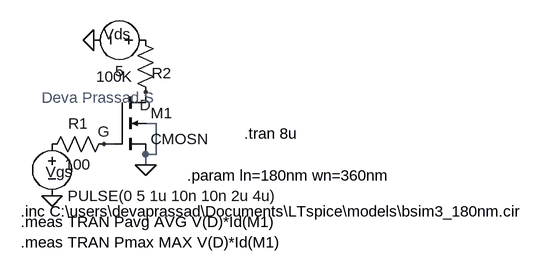
[diagram p0: schematic power.asc]
power.asc, the LTspice schematic file:
Version 4.1
SHEET 1 880 680
WIRE 176 144 160 144
WIRE 112 176 96 176
WIRE 176 192 176 144
WIRE 176 192 160 192
WIRE 160 208 160 192
FLAG 160 208 0
FLAG 80 16 0
FLAG 16 256 0
FLAG 96 176 G
FLAG 160 96 D
SYMBOL nmos4 112 96 R0
SYMATTR InstName M1
SYMATTR Value2 l={ln} w={wn}
SYMATTR Value CMOSN
SYMBOL voltage 16 160 R0
WINDOW 0 -10 59 Left 2
WINDOW 123 0 0 Left 0
WINDOW 39 0 0 Left 0
SYMATTR InstName Vgs
SYMATTR Value PULSE(0 5 1u 10n 10n 2u 4u)
SYMBOL voltage 176 16 R90
WINDOW 0 6 60 VBottom 2
WINDOW 3 32 56 VTop 2
WINDOW 123 0 0 Left 0
WINDOW 39 0 0 Left 0
SYMATTR InstName Vds
SYMATTR Value 5
SYMBOL res 112 160 R90
WINDOW 0 0 56 VBottom 2
WINDOW 3 32 56 VTop 2
SYMATTR InstName R1
SYMATTR Value 100
SYMBOL res 176 112 R180
WINDOW 0 -24 45 Left 2
WINDOW 3 36 40 Left 2
SYMATTR InstName R2
SYMATTR Value 100K
TEXT -32 280 Left 2 !.inc C:\\users\\devaprassad\\Documents\\LTspice\\models\\bsim3_180nm.cir
TEXT 224 224 Left 2 !.param ln=180nm wn=360nm
TEXT 312 160 Left 2 !.tran 8u
TEXT -32 296 Left 2 !.meas TRAN Pavg AVG V(D)*Id(M1)\n.meas TRAN Pmax MAX V(D)*Id(M1)
TEXT 0 104 Left 2 ;Deva Prassad S

The netlist it stands for:
* power.asc
M1 D G 0 0 CMOSN l={ln} w={wn}
Vgs P001 0 PULSE(0 5 1u 10n 10n 2u 4u)
Vds P002 0 5
R1 G P001 100
R2 D P002 100K
.model NMOS NMOS
.model PMOS PMOS
.lib standard.mos
.inc C:\users\devaprassad\Documents\LTspice\models\bsim3_180nm.cir
.param ln=180nm wn=360nm
.tran 8u
.meas TRAN Pavg AVG V(D)*Id(M1)
.meas TRAN Pmax MAX V(D)*Id(M1)
* Deva Prassad S
.backanno
.end